# Altium project PCA9544A.PrjPcb
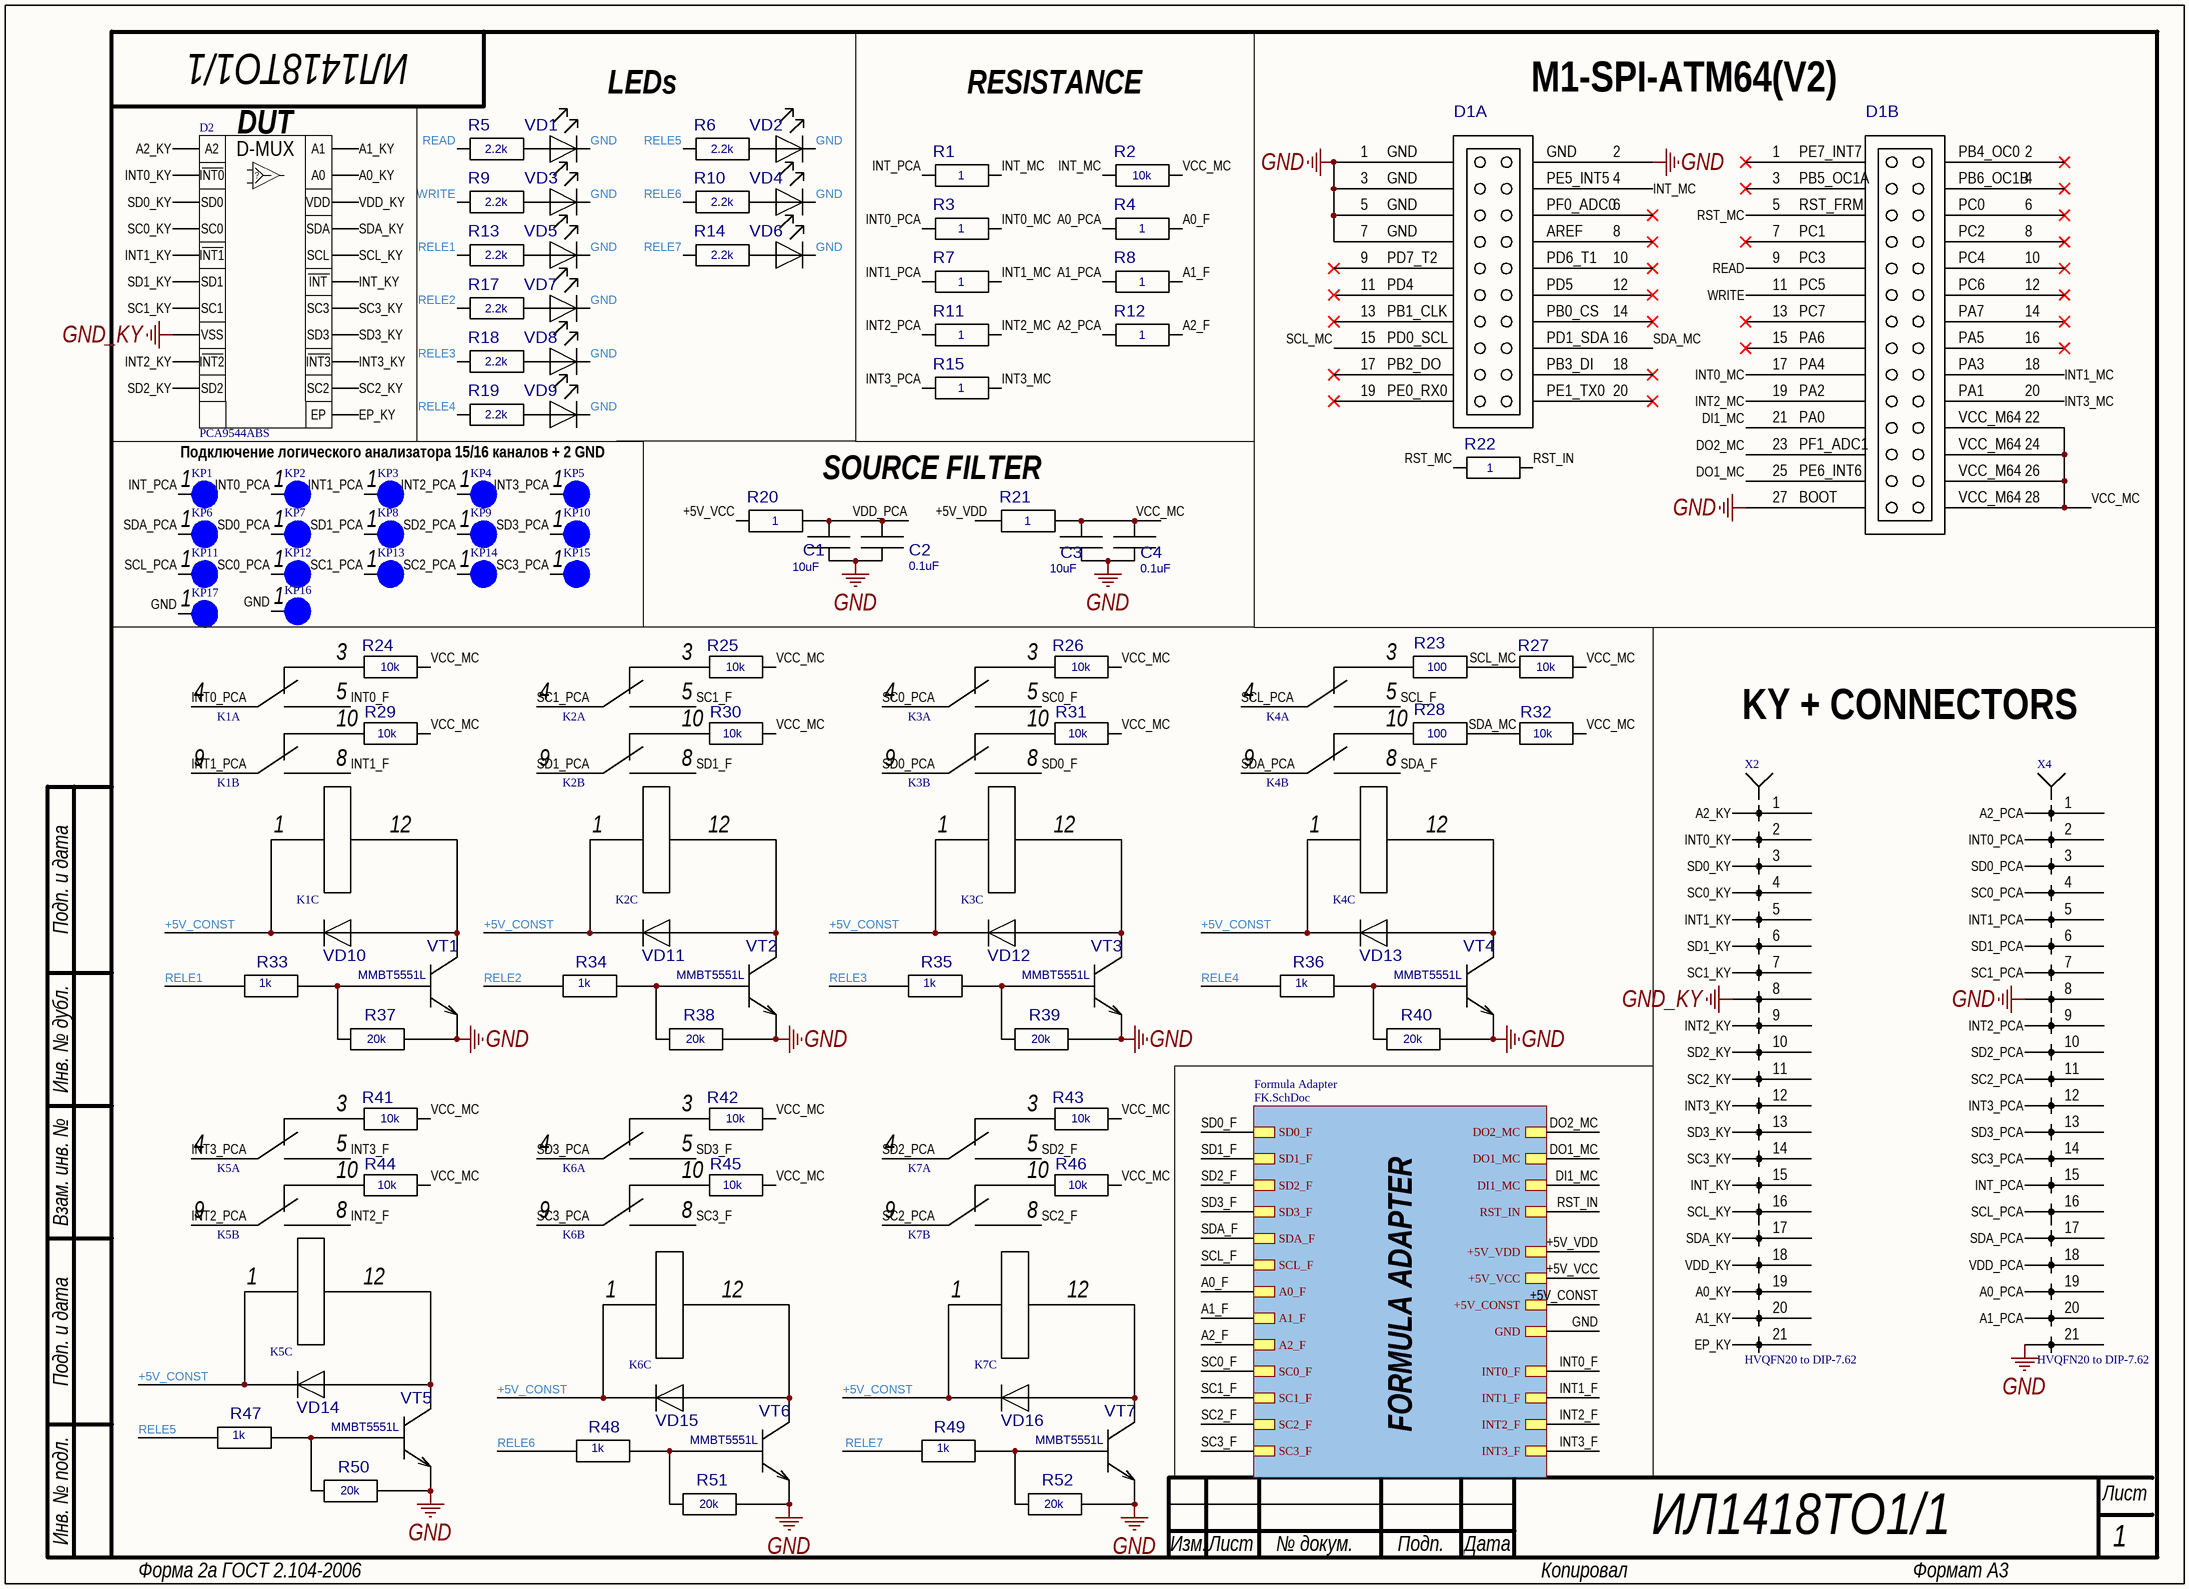
[diagram p0: Sheet1.SchDoc]
2 sheets, 107 parts. Net scope: hierarchical (ports join the sheet entries above them; power ports are global).
Board file: PCB1.PcbDoc
Sheets:
  Sheet1.SchDoc
    Formula Adapter = FK.SchDoc

## Sheet Sheet1.SchDoc: ИЛ1418ТО1/1
size 410 x 297 mm; ApprovedBy: Стерхов В.Д.; CheckedBy: Стерхов В.Д.; Author: Сергеев Д.А.; CompanyName: ГК "СНАБЖЕНИЕ"; DrawnBy: Сергеев Д.А.; Engineer: Сергеев Д.А.; Organization: ГК "СНАБЖЕНИЕ"; DocumentNumber: ИЛ1418ТО1/1; Revision: 1; SheetNumber: 1; SheetTotal: 2

### Parts
C1  10uF  [0805]
C2  0.1uF  [0805]
C3  10uF  [0805]
C4  0.1uF  [0805]
D1  M1-SPI-ATM64(V2)  [M1-SPI-ATM64(V2)]  (value not drawn)  (parts A,B of 2)
D2  PCA9544ABS  [20LQ65TS15050]
K1  V23079A1001B301 TE  [V23079A1001B301]  (value not drawn)  (parts A,B,C of 3)
K2  V23079A1001B301 TE  [V23079A1001B301]  (value not drawn)  (parts A,B,C of 3)
K3  V23079A1001B301 TE  [V23079A1001B301]  (value not drawn)  (parts A,B,C of 3)
K4  V23079A1001B301 TE  [V23079A1001B301]  (value not drawn)  (parts A,B,C of 3)
K5  V23079A1001B301 TE  [V23079A1001B301]  (value not drawn)  (parts A,B,C of 3)
K6  V23079A1001B301 TE  [V23079A1001B301]  (value not drawn)  (parts A,B,C of 3)
K7  V23079A1001B301 TE  [V23079A1001B301]  (value not drawn)  (parts A,B,C of 3)
KP1  Contact  [Contact]  (value not drawn)
KP2  Contact  [Contact]  (value not drawn)
KP3  Contact  [Contact]  (value not drawn)
KP4  Contact  [Contact]  (value not drawn)
KP5  Contact  [Contact]  (value not drawn)
KP6  Contact  [Contact]  (value not drawn)
KP7  Contact  [Contact]  (value not drawn)
KP8  Contact  [Contact]  (value not drawn)
KP9  Contact  [Contact]  (value not drawn)
KP10  Contact  [Contact]  (value not drawn)
KP11  Contact  [Contact]  (value not drawn)
KP12  Contact  [Contact]  (value not drawn)
KP13  Contact  [Contact]  (value not drawn)
KP14  Contact  [Contact]  (value not drawn)
KP15  Contact  [Contact]  (value not drawn)
KP16  Contact  [Contact]  (value not drawn)
KP17  Contact  [Contact]  (value not drawn)
R1  1  [0805]
R2  10k  [0805]
R3  1  [0805]
R4  1  [0805]
R5  2.2k  [0805]
R6  2.2k  [0805]
R7  1  [0805]
R8  1  [0805]
R9  2.2k  [0805]
R10  2.2k  [0805]
R11  1  [0805]
R12  1  [0805]
R13  2.2k  [0805]
R14  2.2k  [0805]
R15  1  [0805]
R17  2.2k  [0805]
R18  2.2k  [0805]
R19  2.2k  [0805]
R20  1  [0805]
R21  1  [0805]
R22  1  [0805]
R23  100  [0805]
R24  10k  [0805]
R25  10k  [0805]
R26  10k  [0805]
R27  10k  [0805]
R28  100  [0805]
R29  10k  [0805]
R30  10k  [0805]
R31  10k  [0805]
R32  10k  [0805]
R33  1k  [0805]
R34  1k  [0805]
R35  1k  [0805]
R36  1k  [0805]
R37  20k  [0805]
R38  20k  [0805]
R39  20k  [0805]
R40  20k  [0805]
R41  10k  [0805]
R42  10k  [0805]
R43  10k  [0805]
R44  10k  [0805]
R45  10k  [0805]
R46  10k  [0805]
R47  1k  [0805]
R48  1k  [0805]
R49  1k  [0805]
R50  20k  [0805]
R51  20k  [0805]
R52  20k  [0805]
VD1  LED(0805)  [0805(LED)]  (value not drawn)
VD2  LED(0805)  [0805(LED)]  (value not drawn)
VD3  LED(0805)  [0805(LED)]  (value not drawn)
VD4  LED(0805)  [0805(LED)]  (value not drawn)
VD5  LED(0805)  [0805(LED)]  (value not drawn)
VD6  LED(0805)  [0805(LED)]  (value not drawn)
VD7  LED(0805)  [0805(LED)]  (value not drawn)
VD8  LED(0805)  [0805(LED)]  (value not drawn)
VD9  LED(0805)  [0805(LED)]  (value not drawn)
VD10  LL4148 NXP  [SOD80C]  (value not drawn)
VD11  LL4148 NXP  [SOD80C]  (value not drawn)
VD12  LL4148 NXP  [SOD80C]  (value not drawn)
VD13  LL4148 NXP  [SOD80C]  (value not drawn)
VD14  LL4148 NXP  [SOD80C]  (value not drawn)
VD15  LL4148 NXP  [SOD80C]  (value not drawn)
VD16  LL4148 NXP  [SOD80C]  (value not drawn)
VT1  MMBT5551L  [SOT-23]
VT2  MMBT5551L  [SOT-23]
VT3  MMBT5551L  [SOT-23]
VT4  MMBT5551L  [SOT-23]
VT5  MMBT5551L  [SOT-23]
VT6  MMBT5551L  [SOT-23]
VT7  MMBT5551L  [SOT-23]
X2  HVQFN20 to DIP-7.62  [HVQFN20 to PD-24]
X4  HVQFN20 to DIP-7.62  [HVQFN20 to PD-24]

### Sub-sheets
Formula Adapter = FK.SchDoc: +5V_VCC, +5V_VDD, SC0_F, SC1_F, SC2_F, SC3_F, SD0_F, SD1_F, SD2_F, SD3_F, SCL_F, SDA_F, INT0_F, INT1_F, INT2_F, INT3_F, DO2_MC, DO1_MC, DI1_MC, RST_IN, +5V_CONST, GND, A0_F, A1_F, A2_F

### Nets
GND: C1.2 C2.2 C3.2 C4.2 D1.1X2 D1.2X2 D1.3X2 D1.5X2 D1.7X2 D1.27X3 KP16.1 KP17.1 R37.2 R38.2 R39.2 R40.2 R50.2 R51.2 R52.2 VD1.2(K) VD2.2(K) VD3.2(K) VD4.2(K) VD5.2(K) VD6.2(K) VD7.2(K) VD8.2(K) VD9.2(K) VT1.2(E) VT2.2(E) VT3.2(E) VT4.2(E) VT5.2(E) VT6.2(E) VT7.2(E) X4.8 X4.21 ; sheet Formula Adapter/GND
GND_KY: D2.8 X2.8
+5V_CONST: K1.1 K2.1 K3.1 K4.1 K5.1 K6.1 K7.1 VD10.2(K) VD11.2(K) VD12.2(K) VD13.2(K) VD14.2(K) VD15.2(K) VD16.2(K) ; sheet Formula Adapter/+5V_CONST
+5V_VCC: R20.1 ; sheet Formula Adapter/+5V_VCC
+5V_VDD: R21.1 ; sheet Formula Adapter/+5V_VDD
A0_F: R4.2 ; sheet Formula Adapter/A0_F
A0_KY: D2.19 X2.19
A0_PCA: R4.1 X4.19
A1_F: R8.2 ; sheet Formula Adapter/A1_F
A1_KY: D2.20 X2.20
A1_PCA: R8.1 X4.20
A2_F: R12.2 ; sheet Formula Adapter/A2_F
A2_KY: D2.1 X2.1
A2_PCA: R12.1 X4.1
DI1_MC: D1.21X3 ; sheet Formula Adapter/DI1_MC
DO1_MC: D1.25X3 ; sheet Formula Adapter/DO1_MC
DO2_MC: D1.23X3 ; sheet Formula Adapter/DO2_MC
EP_KY: D2.21 X2.21
INT0_F: K1.5 ; sheet Formula Adapter/INT0_F
INT0_KY: D2.2 X2.2
INT0_MC: D1.17X3 R3.2
INT0_PCA: K1.4 KP2.1 R3.1 X4.2
INT1_F: K1.8 ; sheet Formula Adapter/INT1_F
INT1_KY: D2.5 X2.5
INT1_MC: D1.18X3 R7.2
INT1_PCA: K1.9 KP3.1 R7.1 X4.5
INT2_F: K5.8 ; sheet Formula Adapter/INT2_F
INT2_KY: D2.9 X2.9
INT2_MC: D1.19X3 R11.2
INT2_PCA: K5.9 KP4.1 R11.1 X4.9
INT3_F: K5.5 ; sheet Formula Adapter/INT3_F
INT3_KY: D2.12 X2.12
INT3_MC: D1.20X3 R15.2
INT3_PCA: K5.4 KP5.1 R15.1 X4.12
INT_KY: D2.15 X2.15
INT_MC: D1.4X2 R1.2 R2.1
INT_PCA: KP1.1 R1.1 X4.15
READ: D1.9X3 R5.1
RELE1: R13.1 R33.1
RELE2: R17.1 R34.1
RELE3: R18.1 R35.1
RELE4: R19.1 R36.1
RELE5: R6.1 R47.1
RELE6: R10.1 R48.1
RELE7: R14.1 R49.1
RST_IN: R22.2 ; sheet Formula Adapter/RST_IN
RST_MC: D1.5X3 R22.1
SC0_F: K3.5 ; sheet Formula Adapter/SC0_F
SC0_KY: D2.4 X2.4
SC0_PCA: K3.4 KP12.1 X4.4
SC1_F: K2.5 ; sheet Formula Adapter/SC1_F
SC1_KY: D2.7 X2.7
SC1_PCA: K2.4 KP13.1 X4.7
SC2_F: K7.8 ; sheet Formula Adapter/SC2_F
SC2_KY: D2.11 X2.11
SC2_PCA: K7.9 KP14.1 X4.11
SC3_F: K6.8 ; sheet Formula Adapter/SC3_F
SC3_KY: D2.14 X2.14
SC3_PCA: K6.9 KP15.1 X4.14
SCL_F: K4.5 ; sheet Formula Adapter/SCL_F
SCL_KY: D2.16 X2.16
SCL_MC: D1.15X2 R23.2 R27.1
SCL_PCA: K4.4 KP11.1 X4.16
SD0_F: K3.8 ; sheet Formula Adapter/SD0_F
SD0_KY: D2.3 X2.3
SD0_PCA: K3.9 KP7.1 X4.3
SD1_F: K2.8 ; sheet Formula Adapter/SD1_F
SD1_KY: D2.6 X2.6
SD1_PCA: K2.9 KP8.1 X4.6
SD2_F: K7.5 ; sheet Formula Adapter/SD2_F
SD2_KY: D2.10 X2.10
SD2_PCA: K7.4 KP9.1 X4.10
SD3_F: K6.5 ; sheet Formula Adapter/SD3_F
SD3_KY: D2.13 X2.13
SD3_PCA: K6.4 KP10.1 X4.13
SDA_F: K4.8 ; sheet Formula Adapter/SDA_F
SDA_KY: D2.17 X2.17
SDA_MC: D1.16X2 R28.2 R32.1
SDA_PCA: K4.9 KP6.1 X4.17
VCC_MC: C3.1 C4.1 D1.22X3 D1.24X3 D1.26X3 D1.28X3 R2.2 R21.2 R24.2 R25.2 R26.2 R27.2 R29.2 R30.2 R31.2 R32.2 R41.2 R42.2 R43.2 R44.2 R45.2 R46.2
VDD_KY: D2.18 X2.18
VDD_PCA: C1.1 C2.1 R20.2 X4.18
WRITE: D1.11X3 R9.1
NetK1_3: K1.3 R24.1
NetK1_10: K1.10 R29.1
NetK1_12: K1.12 VD10.1(A) VT1.3(K)
NetK2_3: K2.3 R25.1
NetK2_10: K2.10 R30.1
NetK2_12: K2.12 VD11.1(A) VT2.3(K)
NetK3_3: K3.3 R26.1
NetK3_10: K3.10 R31.1
NetK3_12: K3.12 VD12.1(A) VT3.3(K)
NetK4_3: K4.3 R23.1
NetK4_10: K4.10 R28.1
NetK4_12: K4.12 VD13.1(A) VT4.3(K)
NetK5_3: K5.3 R41.1
NetK5_10: K5.10 R44.1
NetK5_12: K5.12 VD14.1(A) VT5.3(K)
NetK6_3: K6.3 R42.1
NetK6_10: K6.10 R45.1
NetK6_12: K6.12 VD15.1(A) VT6.3(K)
NetK7_3: K7.3 R43.1
NetK7_10: K7.10 R46.1
NetK7_12: K7.12 VD16.1(A) VT7.3(K)
NetR5_2: R5.2 VD1.1(A)
NetR6_2: R6.2 VD2.1(A)
NetR9_2: R9.2 VD3.1(A)
NetR10_2: R10.2 VD4.1(A)
NetR13_2: R13.2 VD5.1(A)
NetR14_2: R14.2 VD6.1(A)
NetR17_2: R17.2 VD7.1(A)
NetR18_2: R18.2 VD8.1(A)
NetR19_2: R19.2 VD9.1(A)
NetR33_2: R33.2 R37.1 VT1.1(B)
NetR34_2: R34.2 R38.1 VT2.1(B)
NetR35_2: R35.2 R39.1 VT3.1(B)
NetR36_2: R36.2 R40.1 VT4.1(B)
NetR47_2: R47.2 R50.1 VT5.1(B)
NetR48_2: R48.2 R51.1 VT6.1(B)
NetR49_2: R49.2 R52.1 VT7.1(B)

Not connected (* = marked no-connect by the designer): D1 1X3* 2X3* 3X3* 4X3* 6X2* 6X3* 7X3* 8X2* 8X3* 9X2* 10X2* 10X3* 11X2* 12X2* 12X3* 13X2* 13X3* 14X2* 14X3* 15X3* 16X3* 17X2* 18X2* 19X2* 20X2*

### Notes on the sheet
- (near D2) DUT
- LEDs
- RESISTANCE
- M1-SPI-ATM64(V2)
- Подключение логического анализатора 15/16 каналов + 2 GND
- SOURCE FILTER
- KY + CONNECTORS
- FORMULA ADAPTER
- Подп. и дата
- Инв. № дубл.
- Взам. инв. №
- Инв. № подл.
- Изм.
- Лист
- № докум.
- Подп.
- Дата
- Форма 2а ГОСТ 2.104-2006
- Копировал
- Формат А3

### Library data of the parts
C1-C4 = C0805: ComponentHeigt: 1.3; Firme: AVX; Leadform: SMD; KIND: Конденсатор; ClassName: *; Component Link: *; ComponentWeigt: *; Packaging: 0805; NN: *; Value: *
D1 = M1-SPI-ATM64(V2): ComponentHeigt: 5.5; Name: Вилка; Specification: Вилка PLD2-2 *; Typ: PLD2-2; ClassName: *; Component Link: *; ComponentWeigt: *; Firme: *; Leadform: *; NN: *; KIND: *
R1-R15 R17-R52 = R0805 Yageo: ComponentHeigt: 0.6; Firme: Yageo; Leadform: SMD; Kind: Резистор; ClassName: *; ComponentWeigt: *; Component Link: *; Packaging: 0805; NN: *; Value: *
VD1-VD9 = LED(0805): ComponentHeigt: 0.75; Leadform: в отверстия; Firme: Kingbright; NN: 24003000; KIND: Светодиод L-1154GD Kingbright; Component Link: *; ClassName: *
VD10-VD16 = LL4148 NXP: ComponentHeigt: 1.6; Leadform: SMD; NN: 24009301; KIND: Диод LL4148 NXP; Component Link: http://www.nxp.com; Packaging: SOD-80C; ClassName: *; Firme: NXP
VT1-VT7 = MMBT5551L: ComponentHeigt: 1.1; Firme: ONS; Leadform: SMD; NN: 24007468; KIND: Транзистор MMBT5551L*G ONS; ClassName: *; ComponentWeigt: *; Packaging: SOT-23

## Sheet FK.SchDoc: ИЛ1418ТО1/1
size 410 x 297 mm; ApprovedBy: Стерхов В.Д.; CheckedBy: Стерхов В.Д.; Author: Сергеев Д.А.; CompanyName: ГК "СНАБЖЕНИЕ"; DrawnBy: Сергеев Д.А.; Engineer: Сергеев Д.А.; Organization: ГК "СНАБЖЕНИЕ"; DocumentNumber: ИЛ1418ТО1/1; Revision: 1; SheetNumber: 2; SheetTotal: 2
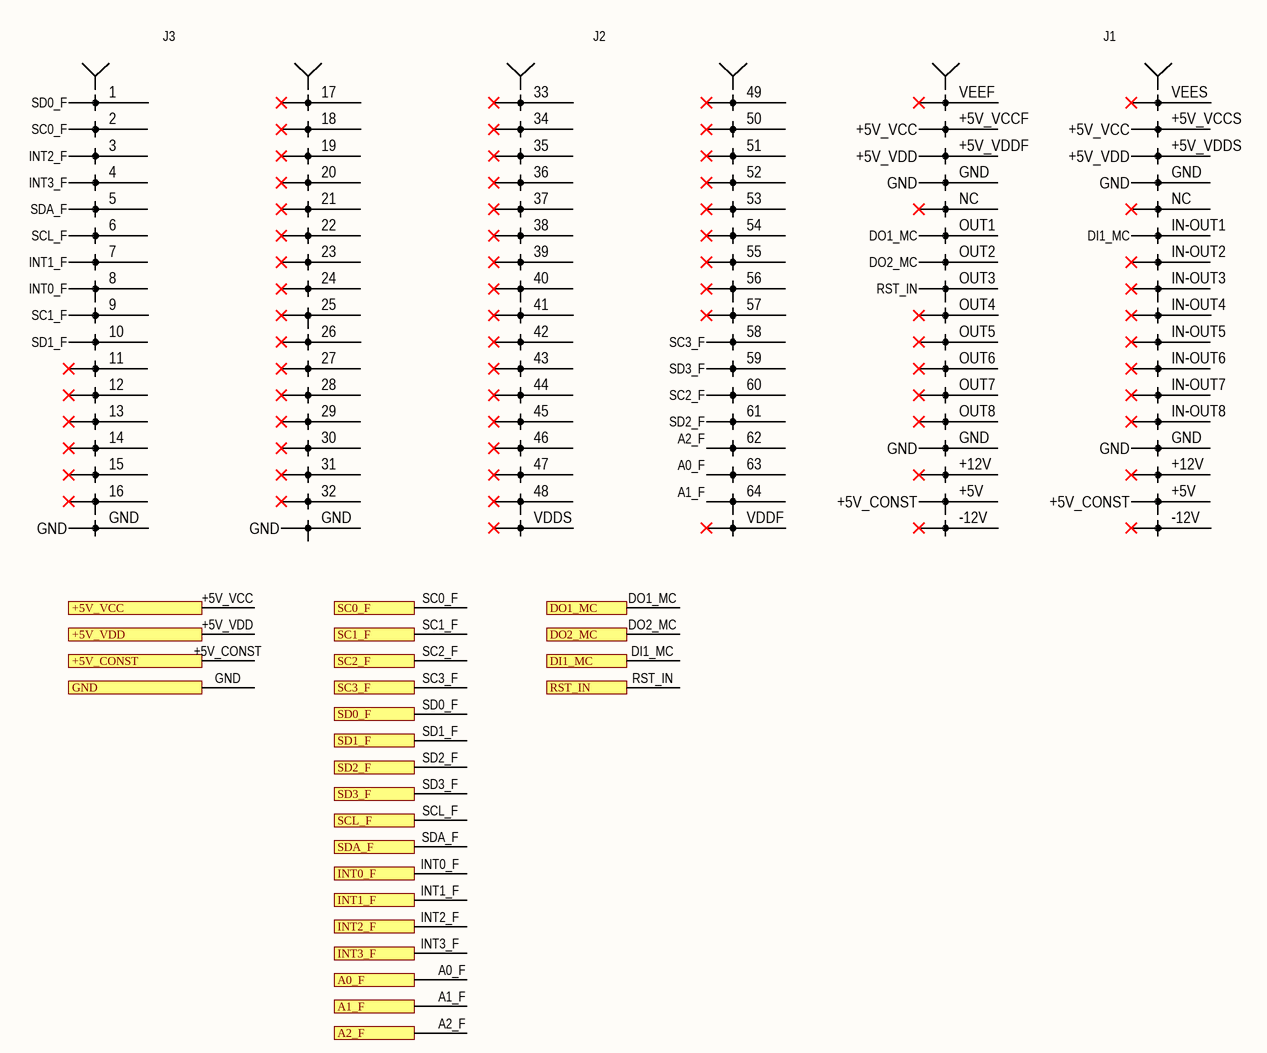
[diagram p1: FK.SchDoc]

### Parts
X1  FORMULA  [FORMULA]  (value not drawn)

### Ports
+5V_CONST, +5V_VCC, +5V_VDD, A0_F, A1_F, A2_F, DI1_MC, DO1_MC, DO2_MC, GND, INT0_F, INT1_F, INT2_F, INT3_F, RST_IN, SC0_F, SC1_F, SC2_F, SC3_F, SCL_F, SD0_F, SD1_F, SD2_F, SD3_F, SDA_F

### Nets
GND: X1.GND ; port GND
+5V_CONST: X1.+5V ; port +5V_CONST
+5V_VCC: X1.+5V_VCCF(VCCF) X1.+5V_VCCS(VCCS) ; port +5V_VCC
+5V_VDD: X1.+5V_VDDF(VDDF) X1.+5V_VDDS(VDDS) ; port +5V_VDD
A0_F: X1.63 ; port A0_F
A1_F: X1.64 ; port A1_F
A2_F: X1.62 ; port A2_F
DI1_MC: X1.IN-OUT1 ; port DI1_MC
DO1_MC: X1.OUT1 ; port DO1_MC
DO2_MC: X1.OUT2 ; port DO2_MC
INT0_F: X1.8 ; port INT0_F
INT1_F: X1.7 ; port INT1_F
INT2_F: X1.3 ; port INT2_F
INT3_F: X1.4 ; port INT3_F
RST_IN: X1.OUT3 ; port RST_IN
SC0_F: X1.2 ; port SC0_F
SC1_F: X1.9 ; port SC1_F
SC2_F: X1.60 ; port SC2_F
SC3_F: X1.58 ; port SC3_F
SCL_F: X1.6 ; port SCL_F
SD0_F: X1.1 ; port SD0_F
SD1_F: X1.10 ; port SD1_F
SD2_F: X1.61 ; port SD2_F
SD3_F: X1.59 ; port SD3_F
SDA_F: X1.5 ; port SDA_F

Not connected (* = marked no-connect by the designer): X1 11* 12* 13* 14* 15* 16* 17* 18* 19* 20* 21* 22* 23* 24* 25* 26* 27* 28* 29* 30* 31* 32* 33* 34* 35* 36(4)* 37(5)* 38* 39* 40* 41* 42* 43* 44* 45* 46* 47* 48* 49* 50* 51* 52* 53* 54* 55* 56* 57* +12V* -12V* IN-OUT2* IN-OUT3* IN-OUT4* IN-OUT5* IN-OUT6* IN-OUT7* IN-OUT8* NC* OUT4* OUT5* OUT6* OUT7* OUT8* VDDF* VDDS* VEEF* VEES*

### Notes on the sheet
- Перв. примен.
- Справ. №
- Подп. и дата
- Инв. № дубл.
- Взам. инв. №
- Разраб.
- Изм.
- Лист
- № докум.
- Подп.
- Дата
- Литера
- Масса
- Масштаб
- Пров.
- Т.контр.
- Листов
- Инв. № подл.
- Н.контр.
- Утв.
- Форма 1 ГОСТ 2.104-2006
- Копировал
- Формат А3
- (in symbol FORMULA) J3; J2; J1

## Nets that join several sheets
GND: Sheet1 (37 pins), FK (X1.GND)
+5V_CONST: Sheet1 (14 pins), FK (X1.+5V)
+5V_VCC: Sheet1 (R20.1), FK (X1.+5V_VCCF X1.+5V_VCCS)
+5V_VDD: Sheet1 (R21.1), FK (X1.+5V_VDDF X1.+5V_VDDS)
A0_F: Sheet1 (R4.2), FK (X1.63)
A1_F: Sheet1 (R8.2), FK (X1.64)
A2_F: Sheet1 (R12.2), FK (X1.62)
DI1_MC: Sheet1 (D1.21X3), FK (X1.IN-OUT1)
DO1_MC: Sheet1 (D1.25X3), FK (X1.OUT1)
DO2_MC: Sheet1 (D1.23X3), FK (X1.OUT2)
INT0_F: Sheet1 (K1.5), FK (X1.8)
INT1_F: Sheet1 (K1.8), FK (X1.7)
INT2_F: Sheet1 (K5.8), FK (X1.3)
INT3_F: Sheet1 (K5.5), FK (X1.4)
RST_IN: Sheet1 (R22.2), FK (X1.OUT3)
SC0_F: Sheet1 (K3.5), FK (X1.2)
SC1_F: Sheet1 (K2.5), FK (X1.9)
SC2_F: Sheet1 (K7.8), FK (X1.60)
SC3_F: Sheet1 (K6.8), FK (X1.58)
SCL_F: Sheet1 (K4.5), FK (X1.6)
SD0_F: Sheet1 (K3.8), FK (X1.1)
SD1_F: Sheet1 (K2.8), FK (X1.10)
SD2_F: Sheet1 (K7.5), FK (X1.61)
SD3_F: Sheet1 (K6.5), FK (X1.59)
SDA_F: Sheet1 (K4.8), FK (X1.5)